# Altium project USB_ISOLATOR_MODULE_2_0.PrjPcb
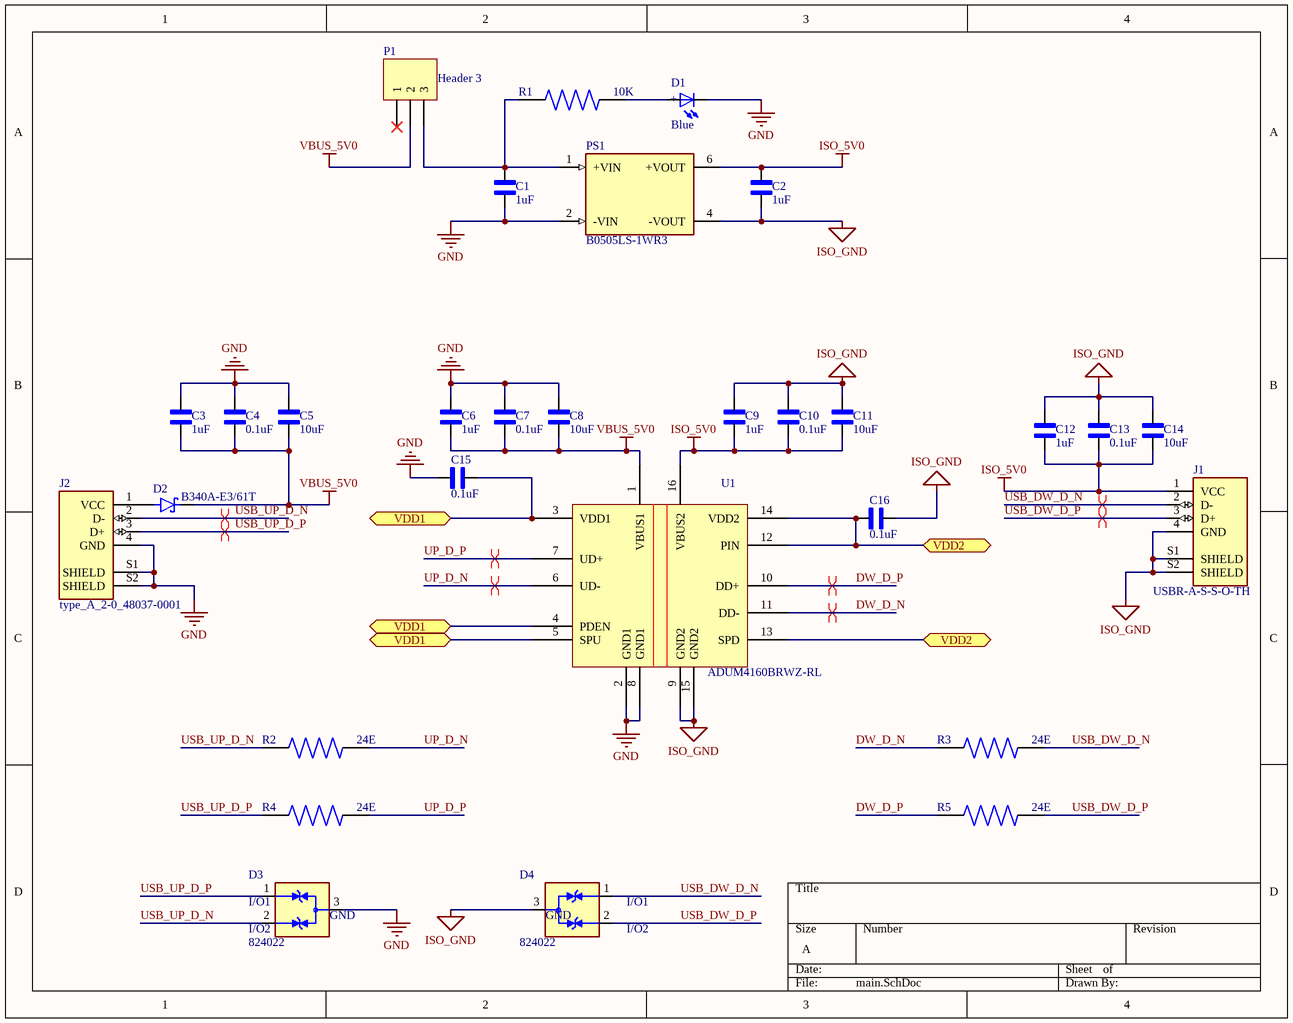
[diagram p0: main.SchDoc]
1 sheet, 30 parts. Net scope: flat (ports and power ports of the same name join across sheets).
Board file: PCB_USB_ISOLATOR.PcbDoc

## Sheet main.SchDoc
size A; SheetNumber: 1; SheetTotal: 1

### Parts
C1  1uF  [CAPC2012X145N]
C2  1uF  [CAPC2012X145N]
C3  1uF  [CAPC2012X145N]
C4  0.1uF  [CAPC1608X94N]
C5  10uF  [CAPC1608X94N]
C6  1uF  [CAPC2012X145N]
C7  0.1uF  [CAPC1608X94N]
C8  10uF  [CAPC1608X94N]
C9  1uF  [CAPC2012X145N]
C10  0.1uF  [CAPC1608X94N]
C11  10uF  [CAPC1608X94N]
C12  1uF  [CAPC2012X145N]
C13  0.1uF  [CAPC1608X94N]
C14  10uF  [CAPC1608X94N]
C15  0.1uF  [CAPC1608X94N]
C16  0.1uF  [CAPC1608X94N]
D1  Blue  [WL-SMCW_1206]
D2  B340A-E3/61T  [DIOM5126X229N]
D3  824022  [WE-TVS_SOT23-3L]
D4  824022  [WE-TVS_SOT23-3L]
J1  USBR-A-S-S-O-TH  [SAMTEC_USBR-A-S-S-O-TH]
J2  type_A_2-0_48037-0001  [MOLEX_48037-0001]
P1  Header 3  [HDR1X3]
PS1  B0505LS-1WR3  [CONV_RFB-0505S]
R1  10K  [RES_ERJU03J474V]
R2  24E  [RES_ERJU03J474V]
R3  24E  [RES_ERJU03J474V]
R4  24E  [RES_ERJU03J474V]
R5  24E  [RES_ERJU03J474V]
U1  ADUM4160BRWZ-RL  [SOIC127P1032X265-16N]

### Ports
VDD1 (bidir), VDD2 (bidir)

### Nets
GND: C1.1 C3.2 C4.2 C5.2 C6.2 C7.2 C8.2 C15.2 D1.1(NEG) D3.3(GND) J2.4(GND) J2.S1(SHIELD) J2.S2(SHIELD) PS1.2(-VIN) U1.2(GND1) U1.8(GND1)
ISO_5V0: C2.2 C9.1 C10.1 C11.1 C12.1 C13.1 C14.1 J1.1(VCC) PS1.6(+VOUT) U1.16(VBUS2)
ISO_GND: C2.1 C9.2 C10.2 C11.2 C12.2 C13.2 C14.2 C16.1 D4.3(GND) J1.4(GND) J1.S1(SHIELD) J1.S2(SHIELD) PS1.4(-VOUT) U1.9(GND2) U1.15(GND2)
VBUS_5V0: C3.1 C4.1 C5.1 C6.1 C7.1 C8.1 D2.C P1.2 U1.1(VBUS1)
DW_D_N: R3.1 U1.11(DD-)
DW_D_P: R5.1 U1.10(DD+)
UP_D_N: R2.2 U1.6(UD-)
UP_D_P: R4.2 U1.7(UD+)
USB_DW_D_N: D4.1(I/O1) J1.2(D-) R3.2
USB_DW_D_P: D4.2(I/O2) J1.3(D+) R5.2
USB_UP_D_N: D3.2(I/O2) J2.2(D-) R2.1
USB_UP_D_P: D3.1(I/O1) J2.3(D+) R4.1
NetC1_2: C1.2 P1.3 PS1.1(+VIN) R1.1
NetC15_1: C15.1 U1.3(VDD1) U1.4(PDEN) U1.5(SPU) ; port VDD1
NetC16_2: C16.2 U1.12(PIN) U1.13(SPD) U1.14(VDD2) ; port VDD2
NetD1_2: D1.2(POS) R1.2
NetD2_A: D2.A J2.1(VCC)

Not connected (* = marked no-connect by the designer): P1 1*

### Layout directives
differential pair: DW_D_N, DW_D_P, UP_D_N, UP_D_P, USB_DW_D_N, USB_DW_D_P, USB_UP_D_N, USB_UP_D_P

### Notes on the sheet
- (in symbol WL-SMCW_1206) +

### Library data of the parts
C1-C3 C6 C9 C12 = cap_0805_VJ0805A681KXCAP: CAP  0805; MF: Vishay Vitramon; SnapEDA_Link: https://www.snapeda.com/parts/VJ0805A681KXCAP/Vishay/view-part/?ref=snap; Package: 2012 Vishay Vitramon; Value: *; MP: VJ0805A681KXCAP; Check_prices: https://www.snapeda.com/parts/VJ0805A681KXCAP/Vishay/view-part/?ref=eda
C4 C5 C7 C8 C10 C11 C13-C16 = cap_0603_VJ0603D3R9DXCAP: cap 0603 (1608 Metric); MF: Vishay Vitramon; SnapEDA_Link: https://www.snapeda.com/parts/VJ0603D3R9DXCAP/Vishay/view-part/?ref=snap; Package: 1608 Vishay Vitramon; Value: *; MP: VJ0603D3R9DXCAP; Check_prices: https://www.snapeda.com/parts/VJ0603D3R9DXCAP/Vishay/view-part/?ref=eda
D1 = WL-SMCW_1206: 1206, Blue Typ.(@20mA): 470nm, 145mcd, 3.2V, 140Â° InGaN; MF: Wurth Electronics; MP: 150120BS75000; SnapEDA_Link: https://www.snapeda.com/parts/150120BS75000/Wurth+Electronics/view-part/?ref=snap; Package: 1206 Wurth Electronics; Value: *; Check_prices: https://www.snapeda.com/parts/150120BS75000/Wurth+Electronics/view-part/?ref=eda
D2 = B340A-E3/61T: Diode Schottky 40 V 3A Surface Mount DO-214AC (SMA); MF: Vishay Semiconductor; SnapEDA_Link: https://www.snapeda.com/parts/B340A-E3/61T/Vishay/view-part/?ref=snap; Package: DO-214 Vishay Semiconductor; Value: *; MP: B340A-E3/61T; Check_prices: https://www.snapeda.com/parts/B340A-E3/61T/Vishay/view-part/?ref=eda
D3 D4 = 824022: 8V Clamp 8A (8/20µs) Ipp Tvs Diode Surface Mount SOT-23-3L, / WE-TVS_SOT23-3L_824022, / 824022 /; MF: {'manufacturer': u'W\xfcrth Elektronik'}; Package: None; Price: None; Value: *; MP: 824022; Availability: Unavailable
J1 = USBR-A-S-S-O-TH: USB-A _USB TYPE-A_ USB 2.0 Receptacle Connector 4 Position Through Hole, Right Angle; MF: Samtec; SnapEDA_Link: https://www.snapeda.com/parts/USBR-A-S-S-O-TH/Samtec%20Inc./view-part/279681/?ref=snap; Availability: Unavailable; Price: None; Package: None; MP: USBR-A-S-S-O-TH; Value: *
J2 = type_A_2-0_48037-0001: USB-A _USB TYPE-A_ USB 2.0 Plug Connector 4 Position Through Hole, Right Angle / 48037-0001; MF: Molex; Package: None; Price: None; SnapEDA_Link: https://www.snapeda.com/parts/48037-0001/Molex/view-part/49135/?ref=snap; Availability: Unavailable; Value: *; MP: 48037-0001
P1 = Header 3: Header, 3-Pin; LatestRevisionDate: 17-Jul-2002; LatestRevisionNote: Re-released for DXP Platform.; Publisher: Altium Limited
PS1 = B0505LS-1WR3: 1W DC/DC-Converter 'ECONOLINE' SIP7 1kV unreg; MF: Recom Power; MP: RFB-0505S; SnapEDA_Link: https://www.snapeda.com/parts/RFB-0505S/Recom+Power/view-part/?ref=snap; Package: SIP-6 Recom Power; Value: *; Check_prices: https://www.snapeda.com/parts/RFB-0505S/Recom+Power/view-part/?ref=eda
R1-R5 = res_0603_ERJU03J474V: 0603 Anti-Sulfurated; MF: Panasonic; SnapEDA_Link: https://www.snapeda.com/parts/ERJU03J474V/Panasonic/view-part/?ref=snap; Package: 1608-2 Panasonic; Value: *; MP: ERJU03J474V; Check_prices: https://www.snapeda.com/parts/ERJU03J474V/Panasonic/view-part/?ref=eda